# Altium project Single_ETU.PrjPcb (part 1 of 2)
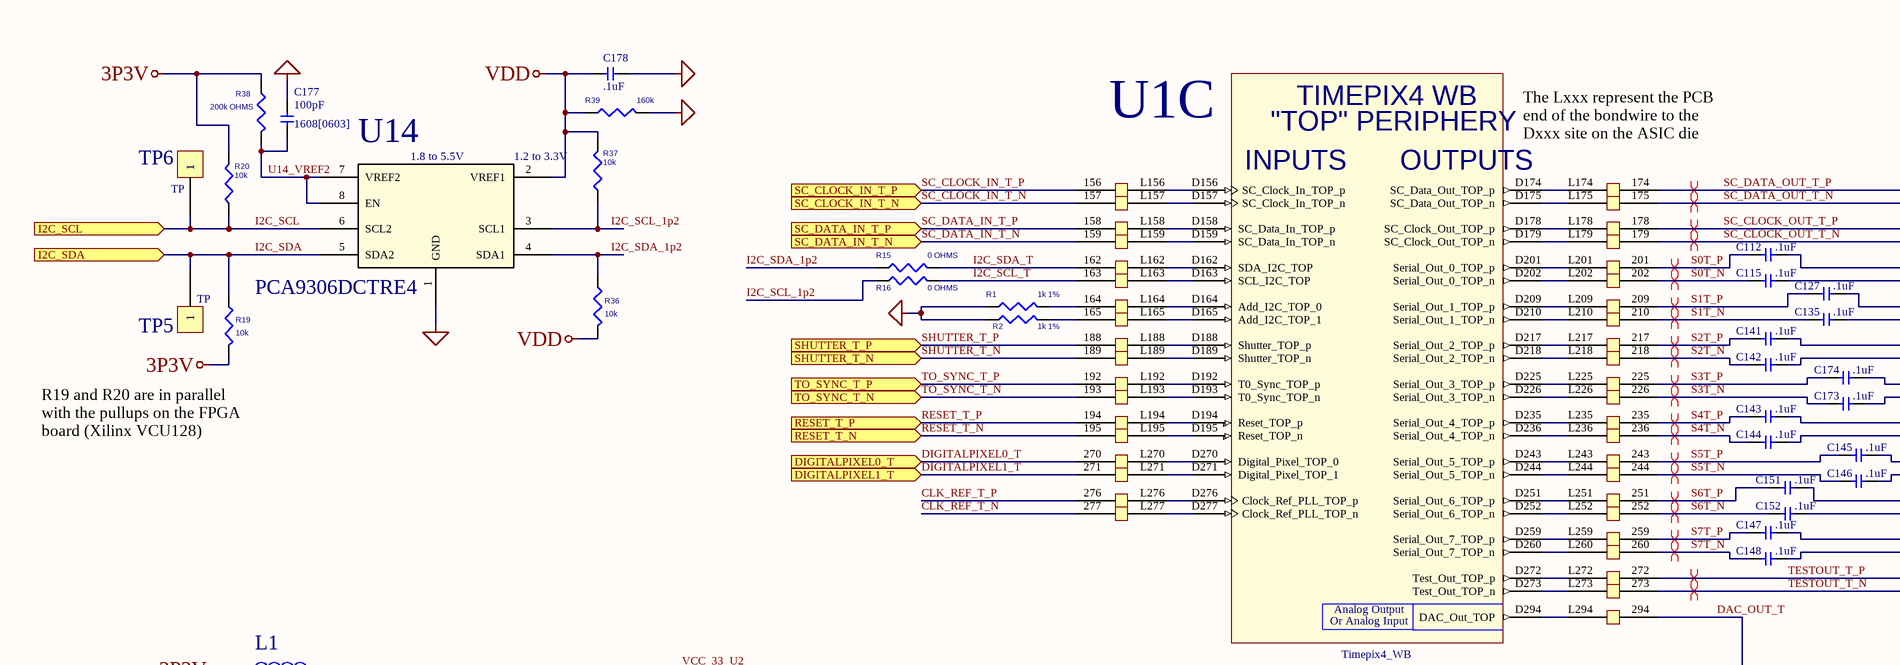
[diagram p0: Single_ETU_sht1_levelshift.SchDoc, top left]
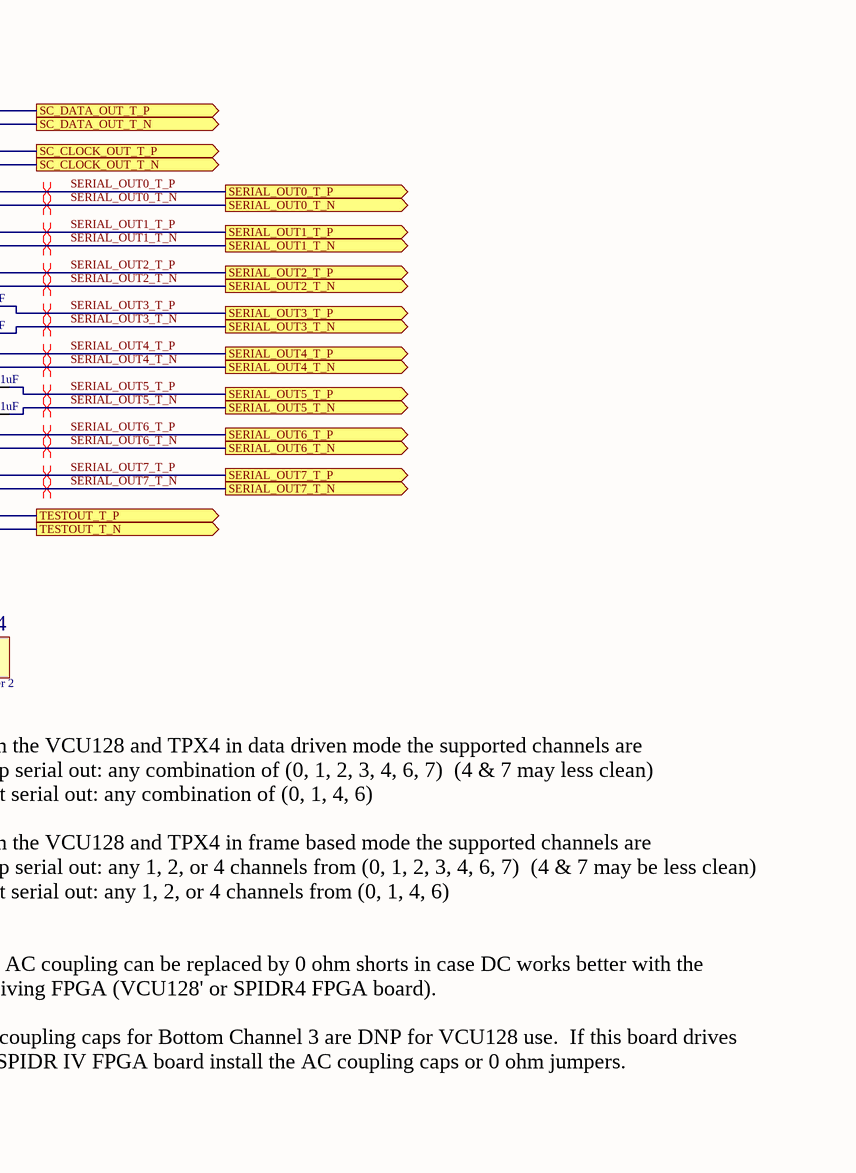
[diagram p1: Single_ETU_sht1_levelshift.SchDoc, top right]
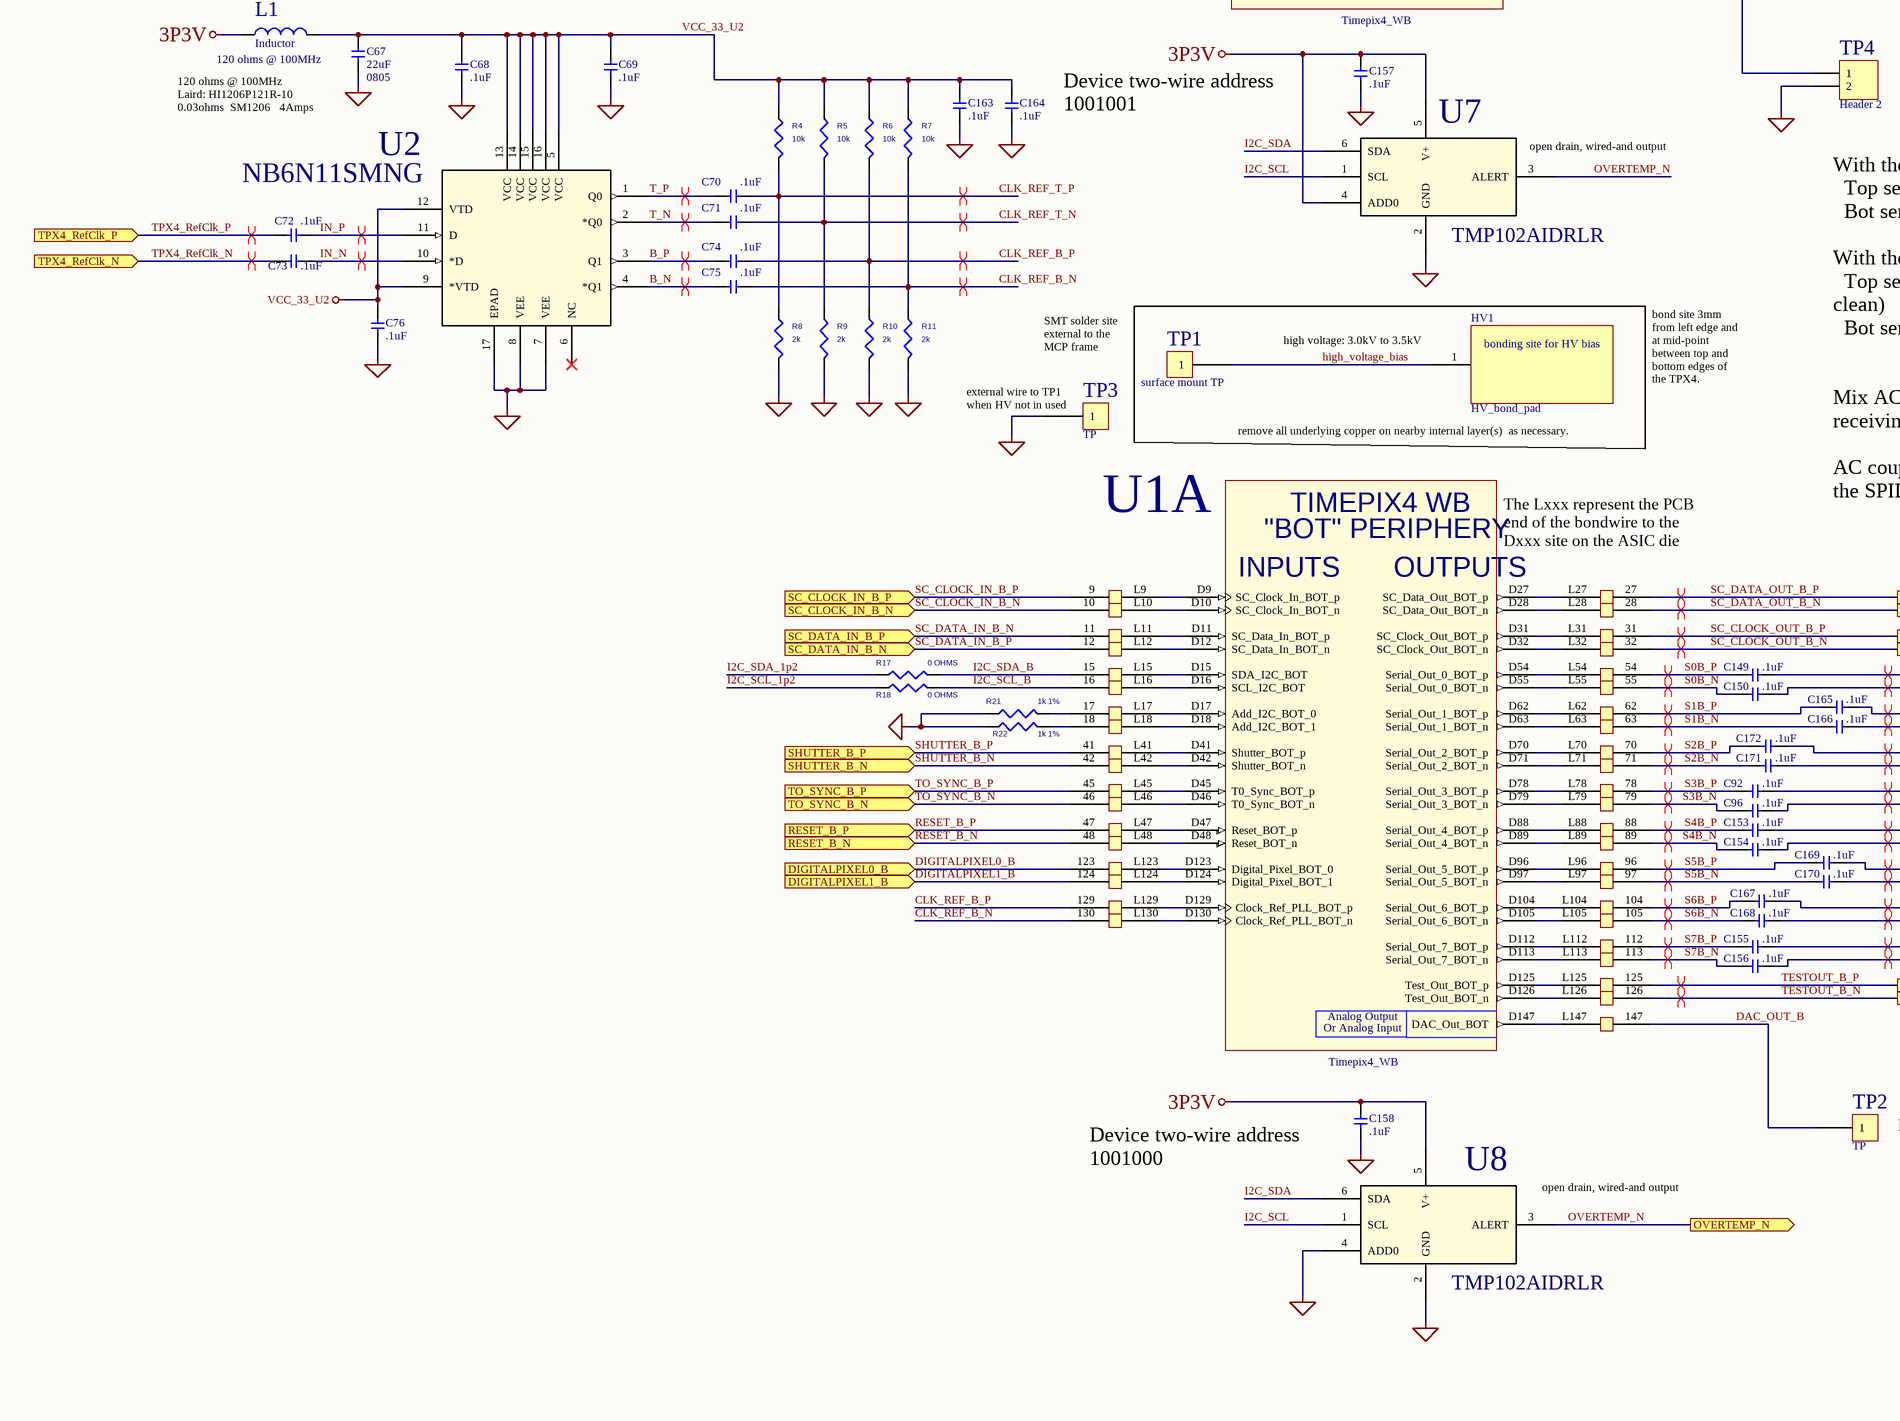
[diagram p2: Single_ETU_sht1_levelshift.SchDoc, bottom left]
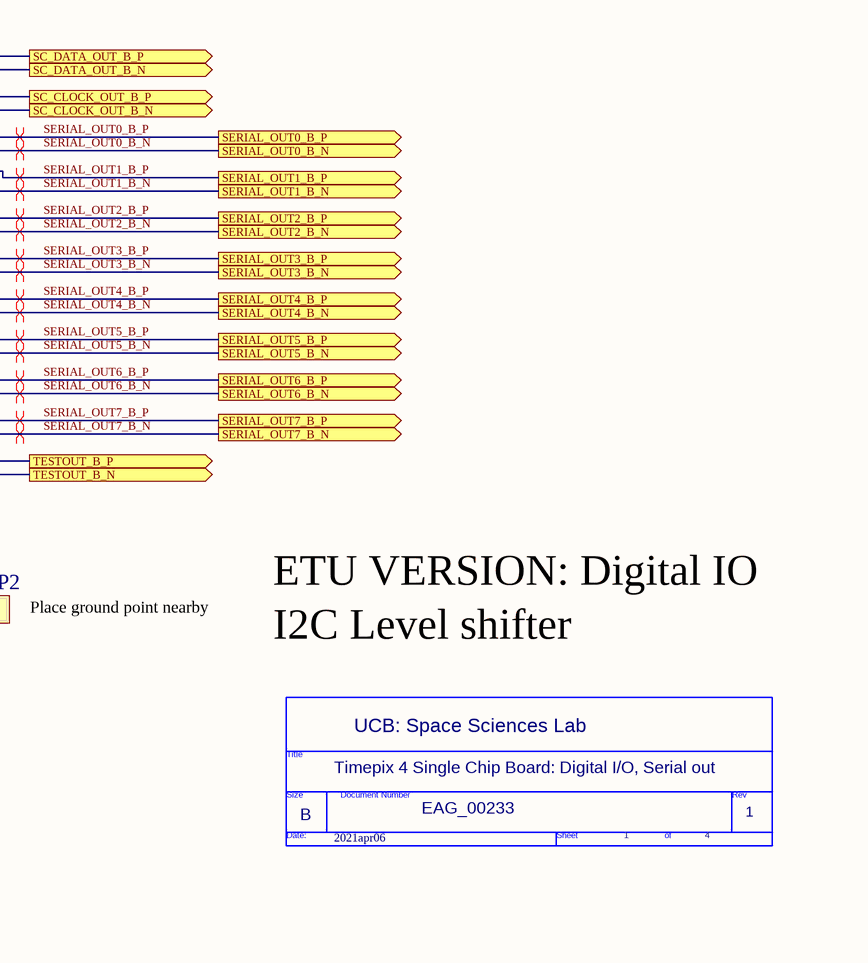
[diagram p3: Single_ETU_sht1_levelshift.SchDoc, bottom right]

3 sheets, 285 parts. Net scope: flat (ports and power ports of the same name join across sheets).
Board file: Single_ETU_b_rev1.PcbDoc
Sheets:
  Single_ETU_sht1_levelshift.SchDoc
  Single_ETU_sht3.SchDoc
  Single_ETU_sht4.SchDoc

## Sheet Single_ETU_sht1_levelshift.SchDoc
size 513 x 386 mm; PageSetup: Record=PageOptions|CenterHorizontal=True|CenterVertical=True|PrintScale=0.69|XCorrection=1.00|YCorrection=1.00|PrintKind=1|BorderSize=5000000|LeftOffset=0|BottomOffset=0|Orientation=2|PaperLength=1000|PaperWidth=1000|Scale=100|PaperSource=15|PrintQuality=1200|MediaType=1|DitherType=10|PrintScaleMode=1|PaperKind=Tabloid|PaperIndex=3

### Parts
(Parts that share a designator on the sheet are numbered #1, #2 ... from top to bottom, then left to right.)
*#1  Page Create Date: 2021apr06  RevCode: 1  Title: Timepix 4 Single Chip Board: Digital I/O, Serial out  OrgName: UCB: Space Sciences Lab  Page Size: B  Page Count: 4  Document: EAG_00233  (hidden comment: TitleBlock2)  (graphical)
C67  22uF  Package / Case: 0805  [C0805]
C68  .1uF  [CAP_0201]
C69  .1uF  [CAP_0201]
C70  .1uF  [CAP_0201]
C71  .1uF  [CAP_0201]
C72  .1uF  [CAP_0201]
C73  .1uF  [CAP_0201]
C74  .1uF  [CAP_0201]
C75  .1uF  [CAP_0201]
C76  .1uF  [CAP_0201]
C92  .1uF  [CAP_0201]
C96  .1uF  [CAP_0201]
C112  .1uF  [CAP_0201]
C115  .1uF  [CAP_0201]
C127  .1uF  [CAP_0201]
C135  .1uF  [CAP_0201]
C141  .1uF  [CAP_0201]
C142  .1uF  [CAP_0201]
C143  .1uF  [CAP_0201]
C144  .1uF  [CAP_0201]
C145  .1uF  [CAP_0201]
C146  .1uF  [CAP_0201]
C147  .1uF  [CAP_0201]
C148  .1uF  [CAP_0201]
C149  .1uF  [CAP_0201]
C150  .1uF  [CAP_0201]
C151  .1uF  [CAP_0201]
C152  .1uF  [CAP_0201]
C153  .1uF  [CAP_0201]
C154  .1uF  [CAP_0201]
C155  .1uF  [CAP_0201]
C156  .1uF  [CAP_0201]
C157  .1uF  [CAP_0201]
C158  .1uF  [CAP_0201]
C163  .1uF  [CAP_0201]
C164  .1uF  [CAP_0201]
C165  .1uF  [CAP_0201]
C166  .1uF  [CAP_0201]
C167  .1uF  [CAP_0201]
C168  .1uF  [CAP_0201]
C169  .1uF  [CAP_0201]
C170  .1uF  [CAP_0201]
C171  .1uF  [CAP_0201]
C172  .1uF  [CAP_0201]
C173  .1uF  [CAP_0201]
C174  .1uF  [CAP_0201]
C177  100pF  [1608[0603]]
C178  .1uF  [CAP_0201]
HV1  HV_bond_pad  [HV_bond_pad]
L1  Inductor  value 120 ohms @ 100MHz  [IND_1206]
R1  1k 1%  [1608[0603]]
R2  1k 1%  [1608[0603]]
R4  10k  [1608[0603]]
R5  10k  [1608[0603]]
R6  10k  [1608[0603]]
R7  10k  [1608[0603]]
R8  2k  [1608[0603]]
R9  2k  [1608[0603]]
R10  2k  [1608[0603]]
R11  2k  [1608[0603]]
R15  0 OHMS  [1608[0603]]
R16  0 OHMS  [1608[0603]]
R17  0 OHMS  [1608[0603]]
R18  0 OHMS  [1608[0603]]
R19  10k  [1608[0603]]
R20  10k  [1608[0603]]
R21  1k 1%  [1608[0603]]
R22  1k 1%  [1608[0603]]
R36  10k  [1608[0603]]
R37  10k  [1608[0603]]
R38  200k OHMS  [1608[0603]]
R39  160k  [1608[0603]]
TP1  surface mount TP  [HV_solder_pad]
TP2  TP  [TP]
TP3  TP  [TP]
TP4  Header 2  [HDR1X2]
TP5  TP  [TP]
TP6  TP  [TP]
U1  Timepix4_WB  [Timepix4_WB_bands]  (parts A,C of 4)
U2  NB6N11SMNG  [QFN16_3x3_mm]
U7  TMP102AIDRLR  [DRL6]
U8  TMP102AIDRLR  [DRL6]
U14  PCA9306DCTRE4  [DCT8]

### Ports
DIGITALPIXEL0_B (in), DIGITALPIXEL0_T (in), DIGITALPIXEL1_B (in), DIGITALPIXEL1_T (in), I2C_SCL (in), I2C_SDA (in), OVERTEMP_N (out), RESET_B_N (in), RESET_B_P (in), RESET_T_N (in), RESET_T_P (in), SC_CLOCK_IN_B_N (in), SC_CLOCK_IN_B_P (in), SC_CLOCK_IN_T_N (in), SC_CLOCK_IN_T_P (in), SC_CLOCK_OUT_B_N (out), SC_CLOCK_OUT_B_P (out), SC_CLOCK_OUT_T_N (out), SC_CLOCK_OUT_T_P (out), SC_DATA_IN_B_N (in), SC_DATA_IN_B_P (in), SC_DATA_IN_T_N (in), SC_DATA_IN_T_P (in), SC_DATA_OUT_B_N (out), SC_DATA_OUT_B_P (out), SC_DATA_OUT_T_N (out), SC_DATA_OUT_T_P (out), SERIAL_OUT0_B_N (out), SERIAL_OUT0_B_P (out), SERIAL_OUT0_T_N (out), SERIAL_OUT0_T_P (out), SERIAL_OUT1_B_N (out), SERIAL_OUT1_B_P (out), SERIAL_OUT1_T_N (out), SERIAL_OUT1_T_P (out), SERIAL_OUT2_B_N (out), SERIAL_OUT2_B_P (out), SERIAL_OUT2_T_N (out), SERIAL_OUT2_T_P (out), SERIAL_OUT3_B_N (out), SERIAL_OUT3_B_P (out), SERIAL_OUT3_T_N (out), SERIAL_OUT3_T_P (out), SERIAL_OUT4_B_N (out), SERIAL_OUT4_B_P (out), SERIAL_OUT4_T_N (out), SERIAL_OUT4_T_P (out), SERIAL_OUT5_B_N (out), SERIAL_OUT5_B_P (out), SERIAL_OUT5_T_N (out), SERIAL_OUT5_T_P (out), SERIAL_OUT6_B_N (out), SERIAL_OUT6_B_P (out), SERIAL_OUT6_T_N (out), SERIAL_OUT6_T_P (out), SERIAL_OUT7_B_N (out), SERIAL_OUT7_B_P (out), SERIAL_OUT7_T_N (out), SERIAL_OUT7_T_P (out), SHUTTER_B_N (in), SHUTTER_B_P (in), SHUTTER_T_N (in), SHUTTER_T_P (in), TESTOUT_B_N (out), TESTOUT_B_P (out), TESTOUT_T_N (out), TESTOUT_T_P (out), TO_SYNC_B_N (in), TO_SYNC_B_P (in), TO_SYNC_T_N (in), TO_SYNC_T_P (in), TPX4_RefClk_N (in), TPX4_RefClk_P (in)

### Nets
3P3V: C157.1 C158.1 L1.1 R19.1 R20.1 R38.1 U7.4(ADD0) U7.5(V+) U8.5(V+)
GND: C67.2 C68.2 C69.2 C76.2 C157.2 C158.2 C163.2 C164.2 C177.2 C178.2 R1.1 R2.1 R8.1 R9.1 R10.1 R11.1 R21.1 R22.1 R39.2 TP3.1 TP4.2 U2.7(VEE) U2.8(VEE) U2.17(EPAD) U7.2(GND) U8.2(GND) U8.4(ADD0) U14.1(GND)
VCC_33_U2: C67.1 C68.1 C69.1 C76.1 C163.1 C164.1 L1.2 R4.2 R5.2 R6.2 R7.2 U2.5(VCC) U2.9(*VTD) U2.12(VTD) U2.13(VCC) U2.14(VCC) U2.15(VCC) U2.16(VCC)
VDD: C178.1 R36.1 R37.1 R39.1 U14.2(VREF1)
B_N: C75.1 U2.4(*Q1)
B_P: C74.1 U2.3(Q1)
CLK_REF_B_N: C75.2 R7.1 R11.2 U1.130
CLK_REF_B_P: C74.2 R6.1 R10.2 U1.129
CLK_REF_T_N: C71.2 R5.1 R9.2 U1.277
CLK_REF_T_P: C70.2 R4.1 R8.2 U1.276
DAC_OUT_B: TP2.1 U1.147
DAC_OUT_T: TP4.1 U1.294
DIGITALPIXEL0_B: U1.123 ; port DIGITALPIXEL0_B
DIGITALPIXEL0_T: U1.270 ; port DIGITALPIXEL0_T
DIGITALPIXEL1_B: U1.124 ; port DIGITALPIXEL1_B
DIGITALPIXEL1_T: U1.271 ; port DIGITALPIXEL1_T
high_voltage_bias: HV1.1 TP1.1
I2C_SCL: R20.2 TP6.1 U7.1(SCL) U8.1(SCL) U14.6(SCL2) ; port I2C_SCL
I2C_SCL_1p2: R16.1 R18.1 R37.2 U14.3(SCL1)
I2C_SCL_B: R18.2 U1.16
I2C_SCL_T: R16.2 U1.163
I2C_SDA: R19.2 TP5.1 U7.6(SDA) U8.6(SDA) U14.5(SDA2) ; port I2C_SDA
I2C_SDA_1p2: R15.1 R17.1 R36.2 U14.4(SDA1)
I2C_SDA_B: R17.2 U1.15
I2C_SDA_T: R15.2 U1.162
IN_N: C73.2 U2.10(*D)
IN_P: C72.2 U2.11(D)
OVERTEMP_N: U7.3(ALERT) U8.3(ALERT) ; port OVERTEMP_N
RESET_B_N: U1.48 ; port RESET_B_N
RESET_B_P: U1.47 ; port RESET_B_P
RESET_T_N: U1.195 ; port RESET_T_N
RESET_T_P: U1.194 ; port RESET_T_P
S0B_N: C150.1 U1.55
S0B_P: C149.1 U1.54
S0T_N: C115.1 U1.202
S0T_P: C112.1 U1.201
S1B_N: C166.1 U1.63
S1B_P: C165.1 U1.62
S1T_N: C135.1 U1.210
S1T_P: C127.1 U1.209
S2B_N: C171.1 U1.71
S2B_P: C172.1 U1.70
S2T_N: C142.1 U1.218
S2T_P: C141.1 U1.217
S3B_N: C96.1 U1.79
S3B_P: C92.1 U1.78
S3T_N: C173.1 U1.226
S3T_P: C174.1 U1.225
S4B_N: C154.1 U1.89
S4B_P: C153.1 U1.88
S4T_N: C144.1 U1.236
S4T_P: C143.1 U1.235
S5B_N: C170.1 U1.97
S5B_P: C169.1 U1.96
S5T_N: C146.1 U1.244
S5T_P: C145.1 U1.243
S6B_N: C168.1 U1.105
S6B_P: C167.1 U1.104
S6T_N: C152.1 U1.252
S6T_P: C151.1 U1.251
S7B_N: C156.1 U1.113
S7B_P: C155.1 U1.112
S7T_N: C148.1 U1.260
S7T_P: C147.1 U1.259
SC_CLOCK_IN_B_N: U1.10 ; port SC_CLOCK_IN_B_N
SC_CLOCK_IN_B_P: U1.9 ; port SC_CLOCK_IN_B_P
SC_CLOCK_IN_T_N: U1.157 ; port SC_CLOCK_IN_T_N
SC_CLOCK_IN_T_P: U1.156 ; port SC_CLOCK_IN_T_P
SC_CLOCK_OUT_B_N: U1.32 ; port SC_CLOCK_OUT_B_N
SC_CLOCK_OUT_B_P: U1.31 ; port SC_CLOCK_OUT_B_P
SC_CLOCK_OUT_T_N: U1.179 ; port SC_CLOCK_OUT_T_N
SC_CLOCK_OUT_T_P: U1.178 ; port SC_CLOCK_OUT_T_P
SC_DATA_IN_B_N: U1.11 ; port SC_DATA_IN_B_P
SC_DATA_IN_B_P: U1.12 ; port SC_DATA_IN_B_N
SC_DATA_IN_T_N: U1.159 ; port SC_DATA_IN_T_N
SC_DATA_IN_T_P: U1.158 ; port SC_DATA_IN_T_P
SC_DATA_OUT_B_N: U1.28 ; port SC_DATA_OUT_B_N
SC_DATA_OUT_B_P: U1.27 ; port SC_DATA_OUT_B_P
SC_DATA_OUT_T_N: U1.175 ; port SC_DATA_OUT_T_N
SC_DATA_OUT_T_P: U1.174 ; port SC_DATA_OUT_T_P
SERIAL_OUT0_B_N: C150.2 ; port SERIAL_OUT0_B_N
SERIAL_OUT0_B_P: C149.2 ; port SERIAL_OUT0_B_P
SERIAL_OUT0_T_N: C115.2 ; port SERIAL_OUT0_T_N
SERIAL_OUT0_T_P: C112.2 ; port SERIAL_OUT0_T_P
SERIAL_OUT1_B_N: C166.2 ; port SERIAL_OUT1_B_N
SERIAL_OUT1_B_P: C165.2 ; port SERIAL_OUT1_B_P
SERIAL_OUT1_T_N: C135.2 ; port SERIAL_OUT1_T_N
SERIAL_OUT1_T_P: C127.2 ; port SERIAL_OUT1_T_P
SERIAL_OUT2_B_N: C171.2 ; port SERIAL_OUT2_B_N
SERIAL_OUT2_B_P: C172.2 ; port SERIAL_OUT2_B_P
SERIAL_OUT2_T_N: C142.2 ; port SERIAL_OUT2_T_N
SERIAL_OUT2_T_P: C141.2 ; port SERIAL_OUT2_T_P
SERIAL_OUT3_B_N: C96.2 ; port SERIAL_OUT3_B_N
SERIAL_OUT3_B_P: C92.2 ; port SERIAL_OUT3_B_P
SERIAL_OUT3_T_N: C173.2 ; port SERIAL_OUT3_T_N
SERIAL_OUT3_T_P: C174.2 ; port SERIAL_OUT3_T_P
SERIAL_OUT4_B_N: C154.2 ; port SERIAL_OUT4_B_N
SERIAL_OUT4_B_P: C153.2 ; port SERIAL_OUT4_B_P
SERIAL_OUT4_T_N: C144.2 ; port SERIAL_OUT4_T_N
SERIAL_OUT4_T_P: C143.2 ; port SERIAL_OUT4_T_P
SERIAL_OUT5_B_N: C170.2 ; port SERIAL_OUT5_B_N
SERIAL_OUT5_B_P: C169.2 ; port SERIAL_OUT5_B_P
SERIAL_OUT5_T_N: C146.2 ; port SERIAL_OUT5_T_N
SERIAL_OUT5_T_P: C145.2 ; port SERIAL_OUT5_T_P
SERIAL_OUT6_B_N: C168.2 ; port SERIAL_OUT6_B_N
SERIAL_OUT6_B_P: C167.2 ; port SERIAL_OUT6_B_P
SERIAL_OUT6_T_N: C152.2 ; port SERIAL_OUT6_T_N
SERIAL_OUT6_T_P: C151.2 ; port SERIAL_OUT6_T_P
SERIAL_OUT7_B_N: C156.2 ; port SERIAL_OUT7_B_N
SERIAL_OUT7_B_P: C155.2 ; port SERIAL_OUT7_B_P
SERIAL_OUT7_T_N: C148.2 ; port SERIAL_OUT7_T_N
SERIAL_OUT7_T_P: C147.2 ; port SERIAL_OUT7_T_P
SHUTTER_B_N: U1.42 ; port SHUTTER_B_N
SHUTTER_B_P: U1.41 ; port SHUTTER_B_P
SHUTTER_T_N: U1.189 ; port SHUTTER_T_N
SHUTTER_T_P: U1.188 ; port SHUTTER_T_P
T_N: C71.1 U2.2(*Q0)
T_P: C70.1 U2.1(Q0)
TESTOUT_B_N: U1.126 ; port TESTOUT_B_N
TESTOUT_B_P: U1.125 ; port TESTOUT_B_P
TESTOUT_T_N: U1.273 ; port TESTOUT_T_N
TESTOUT_T_P: U1.272 ; port TESTOUT_T_P
TO_SYNC_B_N: U1.46 ; port TO_SYNC_B_N
TO_SYNC_B_P: U1.45 ; port TO_SYNC_B_P
TO_SYNC_T_N: U1.193 ; port TO_SYNC_T_N
TO_SYNC_T_P: U1.192 ; port TO_SYNC_T_P
TPX4_RefClk_N: C73.1 ; port TPX4_RefClk_N
TPX4_RefClk_P: C72.1 ; port TPX4_RefClk_P
U14_VREF2: C177.1 R38.2 U14.7(VREF2) U14.8(EN)
NetR1_2: R1.2 U1.164
NetR2_2: R2.2 U1.165
NetR21_2: R21.2 U1.17
NetR22_2: R22.2 U1.18
NetU1_D9: U1.D9(SC_Clock_In_BOT_p) U1.L9
NetU1_D10: U1.D10(SC_Clock_In_BOT_n) U1.L10
NetU1_D11: U1.D11(SC_Data_In_BOT_p) U1.L11
NetU1_D12: U1.D12(SC_Data_In_BOT_n) U1.L12
NetU1_D15: U1.D15(SDA_I2C_BOT) U1.L15
NetU1_D16: U1.D16(SCL_I2C_BOT) U1.L16
NetU1_D17: U1.D17(Add_I2C_BOT_0) U1.L17
NetU1_D18: U1.D18(Add_I2C_BOT_1) U1.L18
NetU1_D27: U1.D27(SC_Data_Out_BOT_p) U1.L27
NetU1_D28: U1.D28(SC_Data_Out_BOT_n) U1.L28
NetU1_D31: U1.D31(SC_Clock_Out_BOT_p) U1.L31
NetU1_D32: U1.D32(SC_Clock_Out_BOT_n) U1.L32
NetU1_D41: U1.D41(Shutter_BOT_p) U1.L41
NetU1_D42: U1.D42(Shutter_BOT_n) U1.L42
NetU1_D45: U1.D45(T0_Sync_BOT_p) U1.L45
NetU1_D46: U1.D46(T0_Sync_BOT_n) U1.L46
NetU1_D47: U1.D47(Reset_BOT_p) U1.L47
NetU1_D48: U1.D48(Reset_BOT_n) U1.L48
NetU1_D54: U1.D54(Serial_Out_0_BOT_p) U1.L54
NetU1_D55: U1.D55(Serial_Out_0_BOT_n) U1.L55
NetU1_D62: U1.D62(Serial_Out_1_BOT_p) U1.L62
NetU1_D63: U1.D63(Serial_Out_1_BOT_n) U1.L63
NetU1_D70: U1.D70(Serial_Out_2_BOT_p) U1.L70
NetU1_D71: U1.D71(Serial_Out_2_BOT_n) U1.L71
NetU1_D78: U1.D78(Serial_Out_3_BOT_p) U1.L78
NetU1_D79: U1.D79(Serial_Out_3_BOT_n) U1.L79
NetU1_D88: U1.D88(Serial_Out_4_BOT_p) U1.L88
NetU1_D89: U1.D89(Serial_Out_4_BOT_n) U1.L89
NetU1_D96: U1.D96(Serial_Out_5_BOT_p) U1.L96
NetU1_D97: U1.D97(Serial_Out_5_BOT_n) U1.L97
NetU1_D104: U1.D104(Serial_Out_6_BOT_p) U1.L104
NetU1_D105: U1.D105(Serial_Out_6_BOT_n) U1.L105
NetU1_D112: U1.D112(Serial_Out_7_BOT_p) U1.L112
NetU1_D113: U1.D113(Serial_Out_7_BOT_n) U1.L113
NetU1_D123: U1.D123(Digital_Pixel_BOT_0) U1.L123
NetU1_D124: U1.D124(Digital_Pixel_BOT_1) U1.L124
NetU1_D125: U1.D125(Test_Out_BOT_p) U1.L125
NetU1_D126: U1.D126(Test_Out_BOT_n) U1.L126
NetU1_D129: U1.D129(Clock_Ref_PLL_BOT_p) U1.L129
NetU1_D130: U1.D130(Clock_Ref_PLL_BOT_n) U1.L130
NetU1_D147: U1.D147(DAC_Out_BOT) U1.L147
NetU1_D156: U1.D156(SC_Clock_In_TOP_p) U1.L156
NetU1_D157: U1.D157(SC_Clock_In_TOP_n) U1.L157
NetU1_D158: U1.D158(SC_Data_In_TOP_p) U1.L158
NetU1_D159: U1.D159(SC_Data_In_TOP_n) U1.L159
NetU1_D162: U1.D162(SDA_I2C_TOP) U1.L162
NetU1_D163: U1.D163(SCL_I2C_TOP) U1.L163
NetU1_D164: U1.D164(Add_I2C_TOP_0) U1.L164
NetU1_D165: U1.D165(Add_I2C_TOP_1) U1.L165
NetU1_D174: U1.D174(SC_Data_Out_TOP_p) U1.L174
NetU1_D175: U1.D175(SC_Data_Out_TOP_n) U1.L175
NetU1_D178: U1.D178(SC_Clock_Out_TOP_p) U1.L178
NetU1_D179: U1.D179(SC_Clock_Out_TOP_n) U1.L179
NetU1_D188: U1.D188(Shutter_TOP_p) U1.L188
NetU1_D189: U1.D189(Shutter_TOP_n) U1.L189
NetU1_D192: U1.D192(T0_Sync_TOP_p) U1.L192
NetU1_D193: U1.D193(T0_Sync_TOP_n) U1.L193
NetU1_D194: U1.D194(Reset_TOP_p) U1.L194
NetU1_D195: U1.D195(Reset_TOP_n) U1.L195
NetU1_D201: U1.D201(Serial_Out_0_TOP_p) U1.L201
NetU1_D202: U1.D202(Serial_Out_0_TOP_n) U1.L202
NetU1_D209: U1.D209(Serial_Out_1_TOP_p) U1.L209
NetU1_D210: U1.D210(Serial_Out_1_TOP_n) U1.L210
NetU1_D217: U1.D217(Serial_Out_2_TOP_p) U1.L217
NetU1_D218: U1.D218(Serial_Out_2_TOP_n) U1.L218
NetU1_D225: U1.D225(Serial_Out_3_TOP_p) U1.L225
NetU1_D226: U1.D226(Serial_Out_3_TOP_n) U1.L226
NetU1_D235: U1.D235(Serial_Out_4_TOP_p) U1.L235
NetU1_D236: U1.D236(Serial_Out_4_TOP_n) U1.L236
NetU1_D243: U1.D243(Serial_Out_5_TOP_p) U1.L243
NetU1_D244: U1.D244(Serial_Out_5_TOP_n) U1.L244
NetU1_D251: U1.D251(Serial_Out_6_TOP_p) U1.L251
NetU1_D252: U1.D252(Serial_Out_6_TOP_n) U1.L252
NetU1_D259: U1.D259(Serial_Out_7_TOP_p) U1.L259
NetU1_D260: U1.D260(Serial_Out_7_TOP_n) U1.L260
NetU1_D270: U1.D270(Digital_Pixel_TOP_0) U1.L270
NetU1_D271: U1.D271(Digital_Pixel_TOP_1) U1.L271
NetU1_D272: U1.D272(Test_Out_TOP_p) U1.L272
NetU1_D273: U1.D273(Test_Out_TOP_n) U1.L273
NetU1_D276: U1.D276(Clock_Ref_PLL_TOP_p) U1.L276
NetU1_D277: U1.D277(Clock_Ref_PLL_TOP_n) U1.L277
NetU1_D294: U1.D294(DAC_Out_TOP) U1.L294

Not connected (* = marked no-connect by the designer): U2 6(NC)*

### Layout directives
differential pair: B_N, B_P, CLK_REF_B_N, CLK_REF_B_P, CLK_REF_T_N, CLK_REF_T_P, IN_N, IN_P, S0B_N, S0B_P, S0T_N, S0T_P, S1B_N, S1B_P, S1T_N, S1T_P, S2B_N, S2B_P, S2T_N, S2T_P, S3B_N, S3B_P, S3T_N, S3T_P, S4B_N, S4B_P, S4T_N, S4T_P, S5B_N, S5B_P, S5T_N, S5T_P, S6B_N, S6B_P, S6T_N, S6T_P, S7B_N, S7B_P, S7T_N, S7T_P, SC_CLOCK_OUT_B_N, SC_CLOCK_OUT_B_P, SC_CLOCK_OUT_T_N, SC_CLOCK_OUT_T_P, SC_DATA_OUT_B_N, SC_DATA_OUT_B_P, SC_DATA_OUT_T_N, SC_DATA_OUT_T_P, SERIAL_OUT0_B_N, SERIAL_OUT0_B_P, SERIAL_OUT0_T_N, SERIAL_OUT0_T_P, SERIAL_OUT1_B_N, SERIAL_OUT1_B_P, SERIAL_OUT1_T_N, SERIAL_OUT1_T_P, SERIAL_OUT2_B_N, SERIAL_OUT2_B_P, SERIAL_OUT2_T_N, SERIAL_OUT2_T_P, SERIAL_OUT3_B_N, SERIAL_OUT3_B_P, SERIAL_OUT3_T_N, SERIAL_OUT3_T_P, SERIAL_OUT4_B_N, SERIAL_OUT4_B_P, SERIAL_OUT4_T_N, SERIAL_OUT4_T_P, SERIAL_OUT5_B_N, SERIAL_OUT5_B_P, SERIAL_OUT5_T_N, SERIAL_OUT5_T_P, SERIAL_OUT6_B_N, SERIAL_OUT6_B_P, SERIAL_OUT6_T_N, SERIAL_OUT6_T_P, SERIAL_OUT7_B_N, SERIAL_OUT7_B_P, SERIAL_OUT7_T_N, SERIAL_OUT7_T_P, T_N, T_P, TESTOUT_B_N, TESTOUT_B_P, TESTOUT_T_N, TESTOUT_T_P, TPX4_RefClk_N, TPX4_RefClk_P

### Notes on the sheet
- (near U1) The Lxxx represent the PCB
  end of the bondwire to the
  Dxxx site on the ASIC die
- (near R19) R19 and R20 are in parallel with the pullups on the FPGA board (Xilinx VCU128)
- 120 ohms @ 100MHz
  Laird: HI1206P121R-10
  0.03ohms  SM1206   4Amps
- Device two-wire address
  1001001
- (near U7) open drain, wired-and output
- SMT solder site external to the MCP frame
- (near HV1) high voltage: 3.0kV to 3.5kV
- (near TP3) external wire to TP1 when HV not in used
- bond site 3mm from left edge and at mid-point between top and bottom edges of the TPX4.
- remove all underlying copper on nearby internal layer(s)  as necessary.
- With the VCU128 and TPX4 in data driven mode the supported channels are
  Top serial out: any combination of (0, 1, 2, 3, 4, 6, 7)  (4 & 7 may less clean)
  Bot serial out: any combination of (0, 1, 4, 6)
  With the VCU128 and TPX4 in frame based mode the supported channels are
  Top serial out: any 1, 2, or 4 channels from (0, 1, 2, 3, 4, 6, 7)  (4 & 7 may be less clean)
  Bot serial out: any 1, 2, or 4 channels from (0, 1, 4, 6)
  Mix AC coupling can be replaced by 0 ohm shorts in case DC works better with the receiving FPGA (VCU128' or SPIDR4 FPGA board).
  AC coupling caps for Bottom Channel 3 are DNP for VCU128 use.  If this board drives the SPIDR IV FPGA board install the AC coupling caps or 0 ohm jumpers.
- ETU VERSION: Digital IO
- Device two-wire address
  1001000
- (near U8) open drain, wired-and output
- (near TP2) Place ground point nearby
- (near *#1) I2C Level shifter
- (in symbol HV_bond_pad) bonding site for HV bias
- (in symbol PCA9306DCTRE4) 1.8 to 5.5V; 1.2 to 3.3V
- (in symbol Timepix4_WB, part A) TIMEPIX4 WB; "BOT" PERIPHERY; INPUTS; OUTPUTS; Analog Output; Or Analog Input
- (in symbol Timepix4_WB, part C) TIMEPIX4 WB; "TOP" PERIPHERY; INPUTS; OUTPUTS; Analog Output; Or Analog Input
- (in symbol TitleBlock2) Title; Size; Document Number; Rev; Date:; Sheet; of

### Library data of the parts
*#1 = TitleBlock2: OrgAddr3: MRD; Page Number: 1
C67 = cap 0.1uF: CAP CER 22UF 10V 10% X5R 0805; Supplier 1: Digi-Key; RoHS: RoHS Compliant; Category: Capacitors; Packaging: Cut Tape (CT); Capacitance: 22uF; Voltage - Rated: 10V; Tolerance: ±10%; Temperature Coefficient: X5R; Mounting Type: Surface Mount, MLCC; Operating Temperature: -55°C ~ 85°C; Applications: General Purpose; Ratings: -; Size / Dimension: 0.079" L x 0.024" W (2.00mm x 1.25mm); Height - Seated (Max): .055" (1.40mm); Thickness (Max): 0.055" (1.4mm); Lead Spacing: -; Features: -; Lead Style: -; ComponentLink1URL: Samsung...; ComponentLink1Description: Samsung...; ComponentLink2URL: Samsung...; ComponentLink3URL: Samsung...
C68-C76 C92 C96 C112 C115 C127 C135 C141-C152 C155-C158 C163-C168 C171-C174 C178 = cap 0.1uF: CAP CER 0.1UF 10V 10% X5R 0201; Voltage - Rated: 6.3V; Supplier 1: Digi-Key; RoHS: RoHS Compliant; Category: Capacitors; Packaging: Cut Tape (CT); Capacitance: .1uF; Tolerance: ±10%; Temperature Coefficient: X5R; Mounting Type: Surface Mount, MLCC; Operating Temperature: -55°C ~ 85°C; Applications: General Purpose; Ratings: -; Package / Case: 0201 (0603 Metric); Size / Dimension: 0.024" L x 0.012" W (0.60mm x 0.30mm); Height - Seated (Max): .013" (0.33mm); Thickness (Max): 0.013" (0.33mm); Lead Spacing: -; Features: -; Lead Style: -
C153 C154 C169 C170 = cap 0.1uF: CAP CER 0.1UF 10V 10% X5R 0201; Voltage - Rated: 6.3V; Assembly comment: DNP for VCU128 use; Supplier 1: Digi-Key; RoHS: RoHS Compliant; Category: Capacitors; Packaging: Cut Tape (CT); Capacitance: .1uF; Tolerance: ±10%; Temperature Coefficient: X5R; Mounting Type: Surface Mount, MLCC; Operating Temperature: -55°C ~ 85°C; Applications: General Purpose; Ratings: -; Package / Case: 0201 (0603 Metric); Size / Dimension: 0.024" L x 0.012" W (0.60mm x 0.30mm); Height - Seated (Max): .013" (0.33mm); Thickness (Max): 0.013" (0.33mm); Lead Spacing: -; Features: -; Lead Style: -
C177 = cap 0.1uF: CAP CER 100pF 10V 10% X5R 0603; Capacitance: 0.01uF; Supplier 1: Digi-Key; RoHS: RoHS Compliant; Category: Capacitors; Packaging: Cut Tape (CT); Voltage - Rated: 10V; Tolerance: ±10%; Temperature Coefficient: X5R; Mounting Type: Surface Mount, MLCC; Operating Temperature: -55°C ~ 85°C; Applications: General Purpose; Ratings: -; Package / Case: 1608[0603]; Size / Dimension: 0.063" L x 0.031" W (1.60mm x 0.80mm); Height - Seated (Max): .037" (0.95mm); Thickness (Max): 0.037" (0.95mm); Lead Spacing: -; Features: -; Lead Style: -; ComponentLink1Description: http://www.tdk.com/pdf/TDKMLCCCapRange.pdf; ComponentLink2URL: http://product.tdk.com/en/catalog/datasheets/mlcc_commercial_general_en.pdf; ComponentLink3URL: http://product.tdk.com/en/catalog/spec/mlccspec_commercial_general_midvoltage_en.pdf
L1 = Inductor: Inductor, 120 ohms @ 100MHz, 4amps, 30mOhm, 1206 (3216 metric); Manufacturer: Laird-Signal Integrity Products; Manufacturer Part Number: HI1206P121R-10; DC Resistance (DCR): 0.03 ohms (Max); Applications: power filter; Inductance: 120 ohms @ 100MHz; Current Rating: 4 Amps; ComponentLink1Description: http://www.lairdtech.com/WorkArea/linkit.aspx?LinkIdentifier=id&ItemID=4849; ComponentLink2Description: http://www.lairdtech.com/WorkArea/linkit.aspx?LinkIdentifier=id&ItemID=1939; ComnponentLink3Description: http://lairdtech.thomasnet.com/Asset/Part-Number-Nomenclature-FErrite-EMI.pdf; Packaging: Cut Tape (CT); Package / Case: 1206 (3216 Metric); Height - Seated (Max): 0.051" (1.30mm); Size / Dimension: 0.126" L x 0.062" W (3.20mm x 1.60mm); Mounting Type: Surface Mount; Operating Temperature: *; RoHS: RoHS Compliant; Supplier 1: Digi-Key; Supplier Part Number 1: 240-2410-1-ND; Pricing 1: 1=0.1, 10=0.087, 25=0.0788, 50=0.0708, 100=0.05190, 250=0.03776, 500=0.0346, 1000=0.02989; Thickness (Max): 0.051" (1.30mm); ComponentLink1URL: http://lairdtech.thomasnet.com/item/differential-mode/chip-beads-power-filtering/pn-5776; Category: Inductors
R1 R2 = R: 1k ohm 1/10W 50V 1% +/- 100 PPM thick film resistor. 0603.; ETU_PN: CRCW06031K00FKEA; ETU_vendor: Digikey; Assembly comment: DNP for bottom side control; ETU_manf: Vishay Dale; manf: State of the Art; PN: M55342K12B1E00R; ETU_PN_PO: 541-1.00KHCT-ND; item: 23b; Min PO QTY: 36; ETU_manf_ds: http://www.vishay.com/docs/20035/dcrcwe3.pdf; ETU_manf_url: http://www.vishay.com/resistors-fixed/list/product-20035/; manf_ds: http://www.resistor.com/assets/pdf/12mil.pdf; manf_url: http://www.resistor.com/pthick_mil.htm; vendor: State of the Art; PN_PO: M55342K12B1E00R; package: RM0603
  R1: Parameter 1: *
R4-R7 = R: 10k ohm 1/10W 50V 1% +/- 25 PPM thin film resistor. 0603.; manf: State of the Art; PN: M55342E12B10E0R; ETU_PN_PO: 541-10.0-KHCT-ND; ETU_manf_ds: http://www.vishay.com/docs/20035/dcrcwe3.pdf; ETU_manf_url: http://www.vishay.com/resistors-fixed/list/product-20035/; manf_ds: http://www.resistor.com/assets/pdf/12milthn.pdf; manf_url: http://www.resistor.com/pthin_mil.htm; vendor: State of the Art; PN_PO: M55342E12B10E0R; package: RM0603
R8-R11 = R: 2k ohm 1/10W 50V 1% +/- 25 PPM thin film resistor. 0603.; manf: State of the Art; manf_ds: http://www.resistor.com/assets/pdf/12milthn.pdf; manf_url: http://www.resistor.com/pthin_mil.htm; vendor: State of the Art; package: RM0603
R15 R16 = R: 0k ohm 0603.; ETU_vendor: Digikey; Assembly comment: DNP for bottom side control; ETU_manf: Vishay Dale; manf: State of the Art; vendor: State of the Art; package: RM0603; Parameter 1: *
R17 R18 = R: 0k ohm 0603.; ETU_vendor: Digikey; Assembly comment: DNP for top side control; ETU_manf: Vishay Dale; manf: State of the Art; vendor: State of the Art; package: RM0603; Parameter 1: *
R19 R36 = R: 4.7k ohm 1/10W 50V 1% +/- 25 PPM thin film resistor. 0603.; manf: State of the Art; PN_PO: 55342E12B10E0R; ETU_manf_ds: http://www.vishay.com/docs/20035/dcrcwe3.pdf; ETU_manf_url: http://www.vishay.com/resistors-fixed/list/product-20035/; manf_ds: http://www.resistor.com/assets/pdf/12milthn.pdf; manf_url: http://www.resistor.com/pthin_mil.htm; vendor: State of the Art; package: RM0603
R20 R37 = R: 4.7k ohm 1/10W 50V 1% +/- 25 PPM thin film resistor. 0603.; manf: State of the Art; ETU_manf_ds: http://www.vishay.com/docs/20035/dcrcwe3.pdf; ETU_manf_url: http://www.vishay.com/resistors-fixed/list/product-20035/; manf_ds: http://www.resistor.com/assets/pdf/12milthn.pdf; manf_url: http://www.resistor.com/pthin_mil.htm; vendor: State of the Art; package: RM0603
R21 R22 = R: 1k ohm 1/10W 50V 1% +/- 100 PPM thick film resistor. 0603.; ETU_PN: CRCW06031K00FKEA; ETU_vendor: Digikey; Assembly comment: DNP for top side control; ETU_manf: Vishay Dale; manf: State of the Art; PN: M55342K12B1E00R; ETU_PN_PO: 541-1.00KHCT-ND; item: 23b; Min PO QTY: 36; ETU_manf_ds: http://www.vishay.com/docs/20035/dcrcwe3.pdf; ETU_manf_url: http://www.vishay.com/resistors-fixed/list/product-20035/; manf_ds: http://www.resistor.com/assets/pdf/12mil.pdf; manf_url: http://www.resistor.com/pthick_mil.htm; vendor: State of the Art; PN_PO: M55342K12B1E00R; package: RM0603
  R21: Parameter 1: *
R38 = R: 200k ohm 0603.; ETU_vendor: Digikey; Assembly comment: DNP for bottom side control; ETU_manf: Vishay Dale; manf: State of the Art; vendor: State of the Art; package: RM0603; Parameter 1: *
R39 = R: 160k ohm 0603.; ETU_vendor: Digikey; Assembly comment: DNP for bottom side control; ETU_manf: Vishay Dale; manf: State of the Art; vendor: State of the Art; package: RM0603; Parameter 1: *
TP1-TP3 TP5 TP6 = TP: test point, wire bonding site
TP4 = Header 2: Header, 2-Pin; LatestRevisionDate: 17-Jul-2002; LatestRevisionNote: Re-released for DXP Platform.; Publisher: Altium Limited
U1 = Timepix4_WB: Wire bonding scenario - Top and Bottom peripheries of of the chip - Updated the 27th June 2020
U2 = NB6L11SMNG: 1 to 2 differential clock driver; Vendor: ON Semiconductor; SourceLibrary: ONSemi_2017-12-12_4; Manufacturer_Part_Number: NB6L11SMNG; Copyright: Copyright (C) 2016 Accelerated Designs. All rights reserved; RefDes: RefDes; Type: DEV
U7 U8 = TMP102AIDRLR: Low Power Digital Temperature Sensor with SMBus/Two-Wire Serial Interface in SOT563; GENERIC_PART_NUMBER: TMP102; Vendor: Texas Instruments; PACKAGE_DESIGNATOR: DRL; PIN_COUNT: 6; INDUSTRY_STD_PKG_TYPE: SOT; Manufacturer_Part_Number: TMP102AIDRLR; FAMILY_NAME: TEMPERATURE SENSOR; Datasheet_URL: http://www.ti.com/lit/gpn/TMP102; Manufacturer: Texas Instruments; Copyright: Copyright (C) 2018 Accelerated Designs. All rights reserved; RefDes: RefDes; Type: DEV
U14 = PCA9306DCTRE4: Dual Bi-Directional I2C-Bus and SMBus Voltage Level-Translator; Manufacturer: Texas Instruments; INDUSTRY_STD_PKG_TYPE: SM8; FAMILY_NAME: I2C SPECIAL FUNCTION; PIN_COUNT: 8; PACKAGE_DESIGNATOR: DCT; Datasheet_URL: http://www.ti.com/lit/gpn/PCA9306; GENERIC_PART_NUMBER: PCA9306; Vendor: Texas Instruments; Manufacturer_Part_Number: PCA9306DCTRE4; Copyright: Copyright (C) 2018 Accelerated Designs. All rights reserved; RefDes: RefDes; Type: DEV

## Sheet Single_ETU_sht3.SchDoc
size B
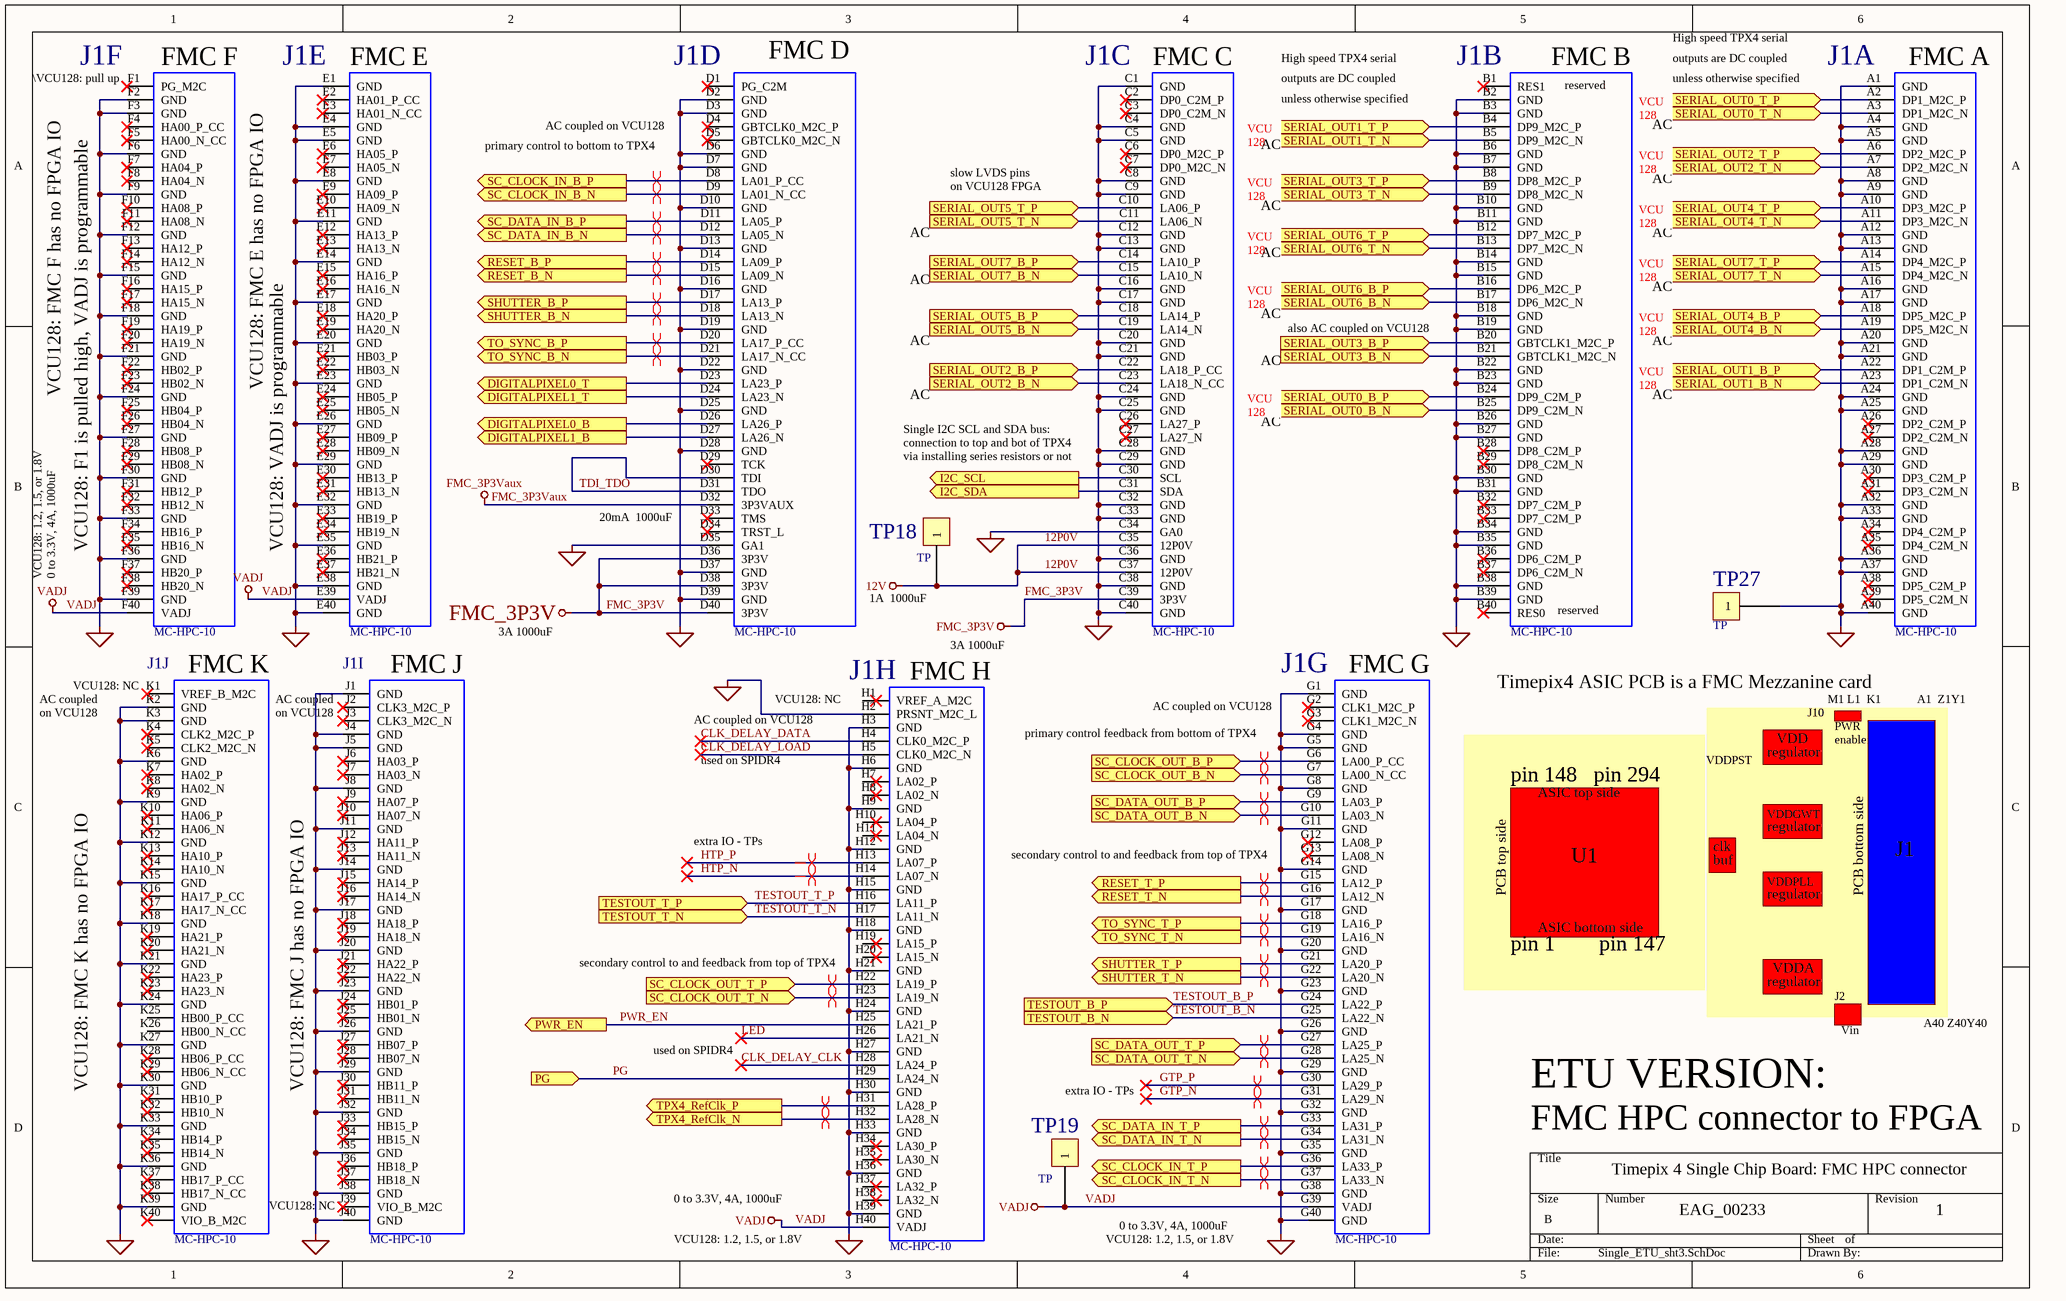
[diagram p4: Single_ETU_sht3.SchDoc]

### Parts
J1  MC-HPC-10  [ASP-134488-01]  (parts A,B,C,D,E,F,G,H,I,J of 10)
TP18  TP  [TP]
TP19  TP  [TP]
TP27  TP  [TP]

### Ports
DIGITALPIXEL0_B (out), DIGITALPIXEL0_T (out), DIGITALPIXEL1_B (out), DIGITALPIXEL1_T (out), I2C_SCL (out), I2C_SDA (out), PG (in), PWR_EN (out), RESET_B_N (out), RESET_B_P (out), RESET_T_N (out), RESET_T_P (out), SC_CLOCK_IN_B_N (out), SC_CLOCK_IN_B_P (out), SC_CLOCK_IN_T_N (out), SC_CLOCK_IN_T_P (out), SC_CLOCK_OUT_B_N (in), SC_CLOCK_OUT_B_P (in), SC_CLOCK_OUT_T_N (in), SC_CLOCK_OUT_T_P (in), SC_DATA_IN_B_N (out), SC_DATA_IN_B_P (out), SC_DATA_IN_T_N (out), SC_DATA_IN_T_P (out), SC_DATA_OUT_B_N (in), SC_DATA_OUT_B_P (in), SC_DATA_OUT_T_N (in), SC_DATA_OUT_T_P (in), SERIAL_OUT0_B_N (in), SERIAL_OUT0_B_P (in), SERIAL_OUT0_T_N (in), SERIAL_OUT0_T_P (in), SERIAL_OUT1_B_N (in), SERIAL_OUT1_B_P (in), SERIAL_OUT1_T_N (in), SERIAL_OUT1_T_P (in), SERIAL_OUT2_B_N (in), SERIAL_OUT2_B_P (in), SERIAL_OUT2_T_N (in), SERIAL_OUT2_T_P (in), SERIAL_OUT3_B_N (in), SERIAL_OUT3_B_P (in), SERIAL_OUT3_T_N (in), SERIAL_OUT3_T_P (in), SERIAL_OUT4_B_N (in), SERIAL_OUT4_B_P (in), SERIAL_OUT4_T_N (in), SERIAL_OUT4_T_P (in), SERIAL_OUT5_B_N (in), SERIAL_OUT5_B_P (in), SERIAL_OUT5_T_N (in), SERIAL_OUT5_T_P (in), SERIAL_OUT6_B_N (in), SERIAL_OUT6_B_P (in), SERIAL_OUT6_T_N (in), SERIAL_OUT6_T_P (in), SERIAL_OUT7_B_N (in), SERIAL_OUT7_B_P (in), SERIAL_OUT7_T_N (in), SERIAL_OUT7_T_P (in), SHUTTER_B_N (out), SHUTTER_B_P (out), SHUTTER_T_N (out), SHUTTER_T_P (out), TESTOUT_B_N (in), TESTOUT_B_P (in), TESTOUT_T_N (in), TESTOUT_T_P (in), TO_SYNC_B_N (out), TO_SYNC_B_P (out), TO_SYNC_T_N (out), TO_SYNC_T_P (out), TPX4_RefClk_N (out), TPX4_RefClk_P (out)

### Nets
12P0V: J1.C35(12P0V) J1.C37(12P0V) TP18.1  [also labelled 12V]
FMC_3P3V: J1.C39(3P3V) J1.D36(3P3V) J1.D38(3P3V) J1.D40(3P3V)
FMC_3P3Vaux: J1.D32(3P3VAUX)
GND: J1.A1(GND) J1.A4(GND) J1.A5(GND) J1.A8(GND) J1.A9(GND) J1.A12(GND) J1.A13(GND) J1.A16(GND) J1.A17(GND) J1.A20(GND) J1.A21(GND) J1.A24(GND) J1.A25(GND) J1.A28(GND) J1.A29(GND) J1.A32(GND) J1.A33(GND) J1.A36(GND) J1.A37(GND) J1.A40(GND) J1.B2(GND) J1.B3(GND) J1.B6(GND) J1.B7(GND) J1.B10(GND) J1.B11(GND) J1.B14(GND) J1.B15(GND) J1.B18(GND) J1.B19(GND) J1.B22(GND) J1.B23(GND) J1.B26(GND) J1.B27(GND) J1.B30(GND) J1.B31(GND) J1.B34(GND) J1.B35(GND) J1.B38(GND) J1.B39(GND) J1.C1(GND) J1.C4(GND) J1.C5(GND) J1.C8(GND) J1.C9(GND) J1.C12(GND) J1.C13(GND) J1.C16(GND) J1.C17(GND) J1.C20(GND) J1.C21(GND) J1.C24(GND) J1.C25(GND) J1.C28(GND) J1.C29(GND) J1.C32(GND) J1.C33(GND) J1.C34(GA0) J1.C36(GND) J1.C38(GND) J1.C40(GND) J1.D2(GND) J1.D3(GND) J1.D6(GND) J1.D7(GND) J1.D10(GND) J1.D13(GND) J1.D16(GND) J1.D19(GND) J1.D22(GND) J1.D25(GND) J1.D28(GND) J1.D35(GA1) J1.D37(GND) J1.D39(GND) J1.E1(GND) J1.E4(GND) J1.E5(GND) J1.E8(GND) J1.E11(GND) J1.E14(GND) J1.E17(GND) J1.E20(GND) J1.E23(GND) J1.E26(GND) J1.E29(GND) J1.E32(GND) J1.E35(GND) J1.E38(GND) J1.E40(GND) J1.F2(GND) J1.F3(GND) J1.F6(GND) J1.F9(GND) J1.F12(GND) J1.F15(GND) J1.F18(GND) J1.F21(GND) J1.F24(GND) J1.F27(GND) J1.F30(GND) J1.F33(GND) J1.F36(GND) J1.F39(GND) J1.G1(GND) J1.G4(GND) J1.G5(GND) J1.G8(GND) J1.G11(GND) J1.G14(GND) J1.G17(GND) J1.G20(GND) J1.G23(GND) J1.G26(GND) J1.G29(GND) J1.G32(GND) J1.G35(GND) J1.G38(GND) J1.G40(GND) J1.H2(PRSNT_M2C_L) J1.H3(GND) J1.H6(GND) J1.H9(GND) J1.H12(GND) J1.H15(GND) J1.H18(GND) J1.H21(GND) J1.H24(GND) J1.H27(GND) J1.H30(GND) J1.H33(GND) J1.H36(GND) J1.H39(GND) J1.J1(GND) J1.J4(GND) J1.J5(GND) J1.J8(GND) J1.J11(GND) J1.J14(GND) J1.J17(GND) J1.J20(GND) J1.J23(GND) J1.J26(GND) J1.J29(GND) J1.J32(GND) J1.J35(GND) J1.J38(GND) J1.J40(GND) J1.K2(GND) J1.K3(GND) J1.K6(GND) J1.K9(GND) J1.K12(GND) J1.K15(GND) J1.K18(GND) J1.K21(GND) J1.K24(GND) J1.K27(GND) J1.K30(GND) J1.K33(GND) J1.K36(GND) J1.K39(GND) TP27.1
VADJ: J1.E39(VADJ) J1.F40(VADJ) J1.G39(VADJ) J1.H40(VADJ) TP19.1
CLK_DELAY_CLK: J1.H28(LA24_P)
CLK_DELAY_DATA: J1.H4(CLK0_M2C_P)
CLK_DELAY_LOAD: J1.H5(CLK0_M2C_N)
DIGITALPIXEL0_B: J1.D26(LA26_P) ; port DIGITALPIXEL0_B
DIGITALPIXEL0_T: J1.D23(LA23_P) ; port DIGITALPIXEL0_T
DIGITALPIXEL1_B: J1.D27(LA26_N) ; port DIGITALPIXEL1_B
DIGITALPIXEL1_T: J1.D24(LA23_N) ; port DIGITALPIXEL1_T
GTP_N: J1.G31(LA29_N)
GTP_P: J1.G30(LA29_P)
HTP_N: J1.H14(LA07_N)
HTP_P: J1.H13(LA07_P)
I2C_SCL: J1.C30(SCL) ; port I2C_SCL
I2C_SDA: J1.C31(SDA) ; port I2C_SDA
LED: J1.H26(LA21_N)
PG: J1.H29(LA24_N) ; port PG
PWR_EN: J1.H25(LA21_P) ; port PWR_EN
RESET_B_N: J1.D15(LA09_N) ; port RESET_B_N
RESET_B_P: J1.D14(LA09_P) ; port RESET_B_P
RESET_T_N: J1.G16(LA12_N) ; port RESET_T_N
RESET_T_P: J1.G15(LA12_P) ; port RESET_T_P
SC_CLOCK_IN_B_N: J1.D9(LA01_N_CC) ; port SC_CLOCK_IN_B_N
SC_CLOCK_IN_B_P: J1.D8(LA01_P_CC) ; port SC_CLOCK_IN_B_P
SC_CLOCK_IN_T_N: J1.G37(LA33_N) ; port SC_CLOCK_IN_T_N
SC_CLOCK_IN_T_P: J1.G36(LA33_P) ; port SC_CLOCK_IN_T_P
SC_CLOCK_OUT_B_N: J1.G7(LA00_N_CC) ; port SC_CLOCK_OUT_B_N
SC_CLOCK_OUT_B_P: J1.G6(LA00_P_CC) ; port SC_CLOCK_OUT_B_P
SC_CLOCK_OUT_T_N: J1.H23(LA19_N) ; port SC_CLOCK_OUT_T_N
SC_CLOCK_OUT_T_P: J1.H22(LA19_P) ; port SC_CLOCK_OUT_T_P
SC_DATA_IN_B_N: J1.D11(LA05_P) ; port SC_DATA_IN_B_P
SC_DATA_IN_B_P: J1.D12(LA05_N) ; port SC_DATA_IN_B_N
SC_DATA_IN_T_N: J1.G34(LA31_N) ; port SC_DATA_IN_T_N
SC_DATA_IN_T_P: J1.G33(LA31_P) ; port SC_DATA_IN_T_P
SC_DATA_OUT_B_N: J1.G10(LA03_N) ; port SC_DATA_OUT_B_N
SC_DATA_OUT_B_P: J1.G9(LA03_P) ; port SC_DATA_OUT_B_P
SC_DATA_OUT_T_N: J1.G28(LA25_N) ; port SC_DATA_OUT_T_N
SC_DATA_OUT_T_P: J1.G27(LA25_P) ; port SC_DATA_OUT_T_P
SERIAL_OUT0_B_N: J1.B25(DP9_C2M_N) ; port SERIAL_OUT0_B_N
SERIAL_OUT0_B_P: J1.B24(DP9_C2M_P) ; port SERIAL_OUT0_B_P
SERIAL_OUT0_T_N: J1.A3(DP1_M2C_N) ; port SERIAL_OUT0_T_N
SERIAL_OUT0_T_P: J1.A2(DP1_M2C_P) ; port SERIAL_OUT0_T_P
SERIAL_OUT1_B_N: J1.A23(DP1_C2M_N) ; port SERIAL_OUT1_B_N
SERIAL_OUT1_B_P: J1.A22(DP1_C2M_P) ; port SERIAL_OUT1_B_P
SERIAL_OUT1_T_N: J1.B5(DP9_M2C_N) ; port SERIAL_OUT1_T_N
SERIAL_OUT1_T_P: J1.B4(DP9_M2C_P) ; port SERIAL_OUT1_T_P
SERIAL_OUT2_B_N: J1.C23(LA18_N_CC) ; port SERIAL_OUT2_B_N
SERIAL_OUT2_B_P: J1.C22(LA18_P_CC) ; port SERIAL_OUT2_B_P
SERIAL_OUT2_T_N: J1.A7(DP2_M2C_N) ; port SERIAL_OUT2_T_N
SERIAL_OUT2_T_P: J1.A6(DP2_M2C_P) ; port SERIAL_OUT2_T_P
SERIAL_OUT3_B_N: J1.B21(GBTCLK1_M2C_N) ; port SERIAL_OUT3_B_N
SERIAL_OUT3_B_P: J1.B20(GBTCLK1_M2C_P) ; port SERIAL_OUT3_B_P
SERIAL_OUT3_T_N: J1.B9(DP8_M2C_N) ; port SERIAL_OUT3_T_N
SERIAL_OUT3_T_P: J1.B8(DP8_M2C_P) ; port SERIAL_OUT3_T_P
SERIAL_OUT4_B_N: J1.A19(DP5_M2C_N) ; port SERIAL_OUT4_B_N
SERIAL_OUT4_B_P: J1.A18(DP5_M2C_P) ; port SERIAL_OUT4_B_P
SERIAL_OUT4_T_N: J1.A11(DP3_M2C_N) ; port SERIAL_OUT4_T_N
SERIAL_OUT4_T_P: J1.A10(DP3_M2C_P) ; port SERIAL_OUT4_T_P
SERIAL_OUT5_B_N: J1.C19(LA14_N) ; port SERIAL_OUT5_B_N
SERIAL_OUT5_B_P: J1.C18(LA14_P) ; port SERIAL_OUT5_B_P
SERIAL_OUT5_T_N: J1.C11(LA06_N) ; port SERIAL_OUT5_T_N
SERIAL_OUT5_T_P: J1.C10(LA06_P) ; port SERIAL_OUT5_T_P
SERIAL_OUT6_B_N: J1.B17(DP6_M2C_N) ; port SERIAL_OUT6_B_N
SERIAL_OUT6_B_P: J1.B16(DP6_M2C_P) ; port SERIAL_OUT6_B_P
SERIAL_OUT6_T_N: J1.B13(DP7_M2C_N) ; port SERIAL_OUT6_T_N
SERIAL_OUT6_T_P: J1.B12(DP7_M2C_P) ; port SERIAL_OUT6_T_P
SERIAL_OUT7_B_N: J1.C15(LA10_N) ; port SERIAL_OUT7_B_N
SERIAL_OUT7_B_P: J1.C14(LA10_P) ; port SERIAL_OUT7_B_P
SERIAL_OUT7_T_N: J1.A15(DP4_M2C_N) ; port SERIAL_OUT7_T_N
SERIAL_OUT7_T_P: J1.A14(DP4_M2C_P) ; port SERIAL_OUT7_T_P
SHUTTER_B_N: J1.D18(LA13_N) ; port SHUTTER_B_N
SHUTTER_B_P: J1.D17(LA13_P) ; port SHUTTER_B_P
SHUTTER_T_N: J1.G22(LA20_N) ; port SHUTTER_T_N
SHUTTER_T_P: J1.G21(LA20_P) ; port SHUTTER_T_P
TDI_TDO: J1.D30(TDI) J1.D31(TDO)
TESTOUT_B_N: J1.G25(LA22_N) ; port TESTOUT_B_N
TESTOUT_B_P: J1.G24(LA22_P) ; port TESTOUT_B_P
TESTOUT_T_N: J1.H17(LA11_N) ; port TESTOUT_T_N
TESTOUT_T_P: J1.H16(LA11_P) ; port TESTOUT_T_P
TO_SYNC_B_N: J1.D21(LA17_N_CC) ; port TO_SYNC_B_N
TO_SYNC_B_P: J1.D20(LA17_P_CC) ; port TO_SYNC_B_P
TO_SYNC_T_N: J1.G19(LA16_N) ; port TO_SYNC_T_N
TO_SYNC_T_P: J1.G18(LA16_P) ; port TO_SYNC_T_P
TPX4_RefClk_N: J1.H32(LA28_N) ; port TPX4_RefClk_N
TPX4_RefClk_P: J1.H31(LA28_P) ; port TPX4_RefClk_P

Not connected (* = marked no-connect by the designer): J1 A26(DP2_C2M_P)* A27(DP2_C2M_N)* A30(DP3_C2M_P)* A31(DP3_C2M_N)* A34(DP4_C2M_P)* A35(DP4_C2M_N)* A38(DP5_C2M_P)* A39(DP5_C2M_N)* B1(RES1)* B28(DP8_C2M_P)* B29(DP8_C2M_N)* B32(DP7_C2M_P)* B33(DP7_C2M_P)* B36(DP6_C2M_P)* B37(DP6_C2M_N)* B40(RES0)* C2(DP0_C2M_P)* C3(DP0_C2M_N)* C6(DP0_M2C_P)* C7(DP0_M2C_N)* C26(LA27_P)* C27(LA27_N)* D1(PG_C2M)* D4(GBTCLK0_M2C_P)* D5(GBTCLK0_M2C_N)* D29(TCK)* D33(TMS)* D34(TRST_L)* E2(HA01_P_CC)* E3(HA01_N_CC)* E6(HA05_P)* E7(HA05_N)* E9(HA09_P)* E10(HA09_N)* E12(HA13_P)* E13(HA13_N)* E15(HA16_P)* E16(HA16_N)* E18(HA20_P)* E19(HA20_N)* E21(HB03_P)* E22(HB03_N)* E24(HB05_P)* E25(HB05_N)* E27(HB09_P)* E28(HB09_N)* E30(HB13_P)* E31(HB13_N)* E33(HB19_P)* E34(HB19_N)* E36(HB21_P)* E37(HB21_N)* F1(PG_M2C)* F4(HA00_P_CC)* F5(HA00_N_CC)* F7(HA04_P)* F8(HA04_N)* F10(HA08_P)* F11(HA08_N)* F13(HA12_P)* F14(HA12_N)* F16(HA15_P)* F17(HA15_N)* F19(HA19_P)* F20(HA19_N)* F22(HB02_P)* F23(HB02_N)* F25(HB04_P)* F26(HB04_N)* F28(HB08_P)* F29(HB08_N)* F31(HB12_P)* F32(HB12_N)* F34(HB16_P)* F35(HB16_N)* F37(HB20_P)* F38(HB20_N)* G2(CLK1_M2C_P)* G3(CLK1_M2C_N)* G12(LA08_P)* G13(LA08_N)* H1(VREF_A_M2C) H7(LA02_P) H8(LA02_N) H10(LA04_P) H11(LA04_N) H19(LA15_P) H20(LA15_N) H34(LA30_P) H35(LA30_N) H37(LA32_P) H38(LA32_N) J2(CLK3_M2C_P)* J3(CLK3_M2C_N)* J6(HA03_P)* J7(HA03_N)* J9(HA07_P)* J10(HA07_N)* J12(HA11_P)* J13(HA11_N)* J15(HA14_P)* J16(HA14_N)* J18(HA18_P)* J19(HA18_N)* J21(HA22_P)* J22(HA22_N)* J24(HB01_P)* J25(HB01_N)* J27(HB07_P)* J28(HB07_N)* J30(HB11_P)* J31(HB11_N)* J33(HB15_P)* J34(HB15_N)* J36(HB18_P)* J37(HB18_N)* J39(VIO_B_M2C)* K1(VREF_B_M2C)* K4(CLK2_M2C_P)* K5(CLK2_M2C_N)* K7(HA02_P)* K8(HA02_N)* K10(HA06_P)* K11(HA06_N)* K13(HA10_P)* K14(HA10_N)* K16(HA17_P_CC)* K17(HA17_N_CC)* K19(HA21_P)* K20(HA21_N)* K22(HA23_P)* K23(HA23_N)* K25(HB00_P_CC) K26(HB00_N_CC) K28(HB06_P_CC)* K29(HB06_N_CC)* K31(HB10_P)* K32(HB10_N)* K34(HB14_P)* K35(HB14_N)* K37(HB17_P_CC)* K38(HB17_N_CC)* K40(VIO_B_M2C)*

### Layout directives
differential pair: GTP_N, GTP_P, HTP_N, HTP_P, RESET_B_N, RESET_B_P, RESET_T_N, RESET_T_P, SC_CLOCK_IN_B_N, SC_CLOCK_IN_B_P, SC_CLOCK_IN_T_N, SC_CLOCK_IN_T_P, SC_CLOCK_OUT_B_N, SC_CLOCK_OUT_B_P, SC_CLOCK_OUT_T_N, SC_CLOCK_OUT_T_P, SC_DATA_IN_B_N, SC_DATA_IN_B_P, SC_DATA_IN_T_N, SC_DATA_IN_T_P, SC_DATA_OUT_B_N, SC_DATA_OUT_B_P, SC_DATA_OUT_T_N, SC_DATA_OUT_T_P, SHUTTER_B_N, SHUTTER_B_P, SHUTTER_T_N, SHUTTER_T_P, TO_SYNC_B_N, TO_SYNC_B_P, TO_SYNC_T_N, TO_SYNC_T_P, TPX4_RefClk_N, TPX4_RefClk_P

### Notes on the sheet
- (near J1) \VCU128: pull up
- (near J1) FMC F
- (near J1) FMC E
- (near J1) FMC D
- (near J1) FMC C
- High speed TPX4 serial
- outputs are DC coupled
- unless otherwise specified
- (near J1) FMC B
- reserved
- (near J1) FMC A
- (near J1) primary control to bottom to TPX4
- AC coupled on VCU128
- VCU
  128
- AC
- slow LVDS pins
- on VCU128 FPGA
- also AC coupled on VCU128
- VCU128: FMC F has no FPGA IO
- VCU128: FMC E has no FPGA IO
- Single I2C SCL and SDA bus:
- (near J1) connection to top and bot of TPX4
- (near J1) via installing series resistors or not
- VCU128: F1 is pulled high, VADJ is programmable
- VCU128: VADJ is programmable
- 20mA  1000uF
- VCU128: 1.2, 1.5, or 1.8V
- 0 to 3.3V, 4A, 1000uF
- 3A 1000uF
- (near TP18) 1A  1000uF
- (near J1) reserved
- AC coupled
- (near J1) VCU128: NC
- (near J1) FMC K
- (near J1) AC coupled
- (near J1) FMC J
- VCU128: NC
- (near J1) FMC H
- (near J1) FMC G
- Timepix4 ASIC PCB is a FMC Mezzanine card
- M1 L1  K1            A1  Z1Y1
- on VCU128
- (near J1) on VCU128
- used on SPIDR4
- (near J1) primary control feedback from bottom of TPX4
- VDDPST
- regulator
- VDD
- J10
- PWR
- enable
- pin 148   pin 294
- ASIC top side
- VDDGWT
- extra IO - TPs
- (near J1) secondary control to and feedback from top of TPX4
- PCB top side
- U1
- clk
- buf
- VDDPLL
- PCB bottom side
- J1
- pin 1        pin 147
- ASIC bottom side
- VDDA
- J2
- Vin
- A40 Z40Y40
- VCU128: FMC K has no FPGA IO
- VCU128: FMC J has no FPGA IO
- ETU VERSION:
- FMC HPC connector to FPGA
- Timepix 4 Single Chip Board: FMC HPC connector
- EAG_00233
- 1

### Library data of the parts
J1 = MC-HPC-10: MC-HPC-10, FMC High-pin count connector, lead free, 400 I/Os, male, 10 mm mated stack height; Manufacturer: Samtec; Manufacturer Ref: SEAM-40-03.5-S-10-2-A-K-TR-VITA57.0; Pitch: 1.27 mm; Mated Stack Height: 10 mm; Solder Type: Lead-Free; Number I/O: 400; PartName: ASP-134488-01; Part: ASP-134488-01; Vita PartNumber: MC-HPC-10; Pin Count: High; Gender: male; Supplier 1: Digi-Key; Supplier Part Number 1: SAM8730-ND
TP18 TP19 TP27 = TP: test point, wire bonding site